# Altium schematic sheet Power_Neg15.SchDoc: Geracao interna de -15 V
size A3; Project: CM5 Photonic Bias Controller; DocumentRev: R5; ProjectRev: R5; Version: Rev R6; SheetNumber: 17; SheetTotal: 17; Author: Carlos Renan; SCH_SCALE: N/A; Address1: UFCG; Address2: Referencia: VIRTUS CC; Address3: Campina Grande - PB; ProjectName: Controle automatico de BIAS para MZM/IQ - Projeto 3; DocumentName: Power_Neg15.SchDoc
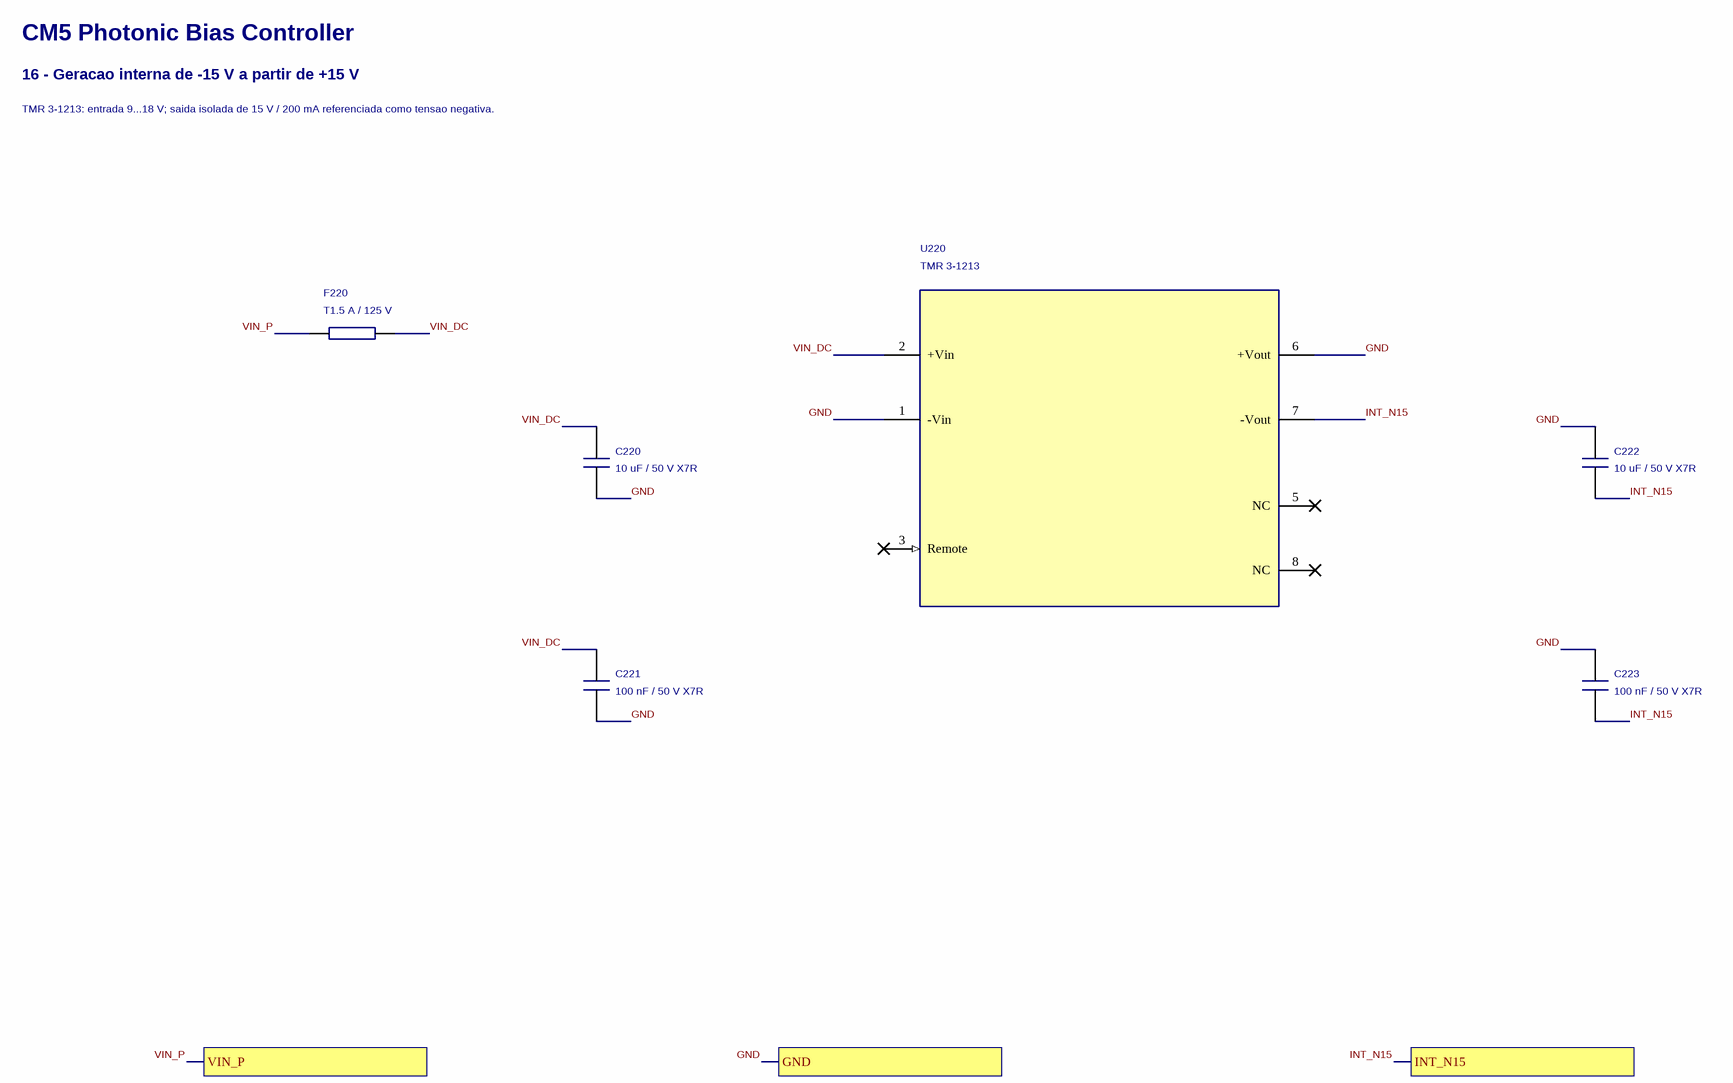
[diagram p0: Power_Neg15.SchDoc]

## Parts
C220  10 uF / 50 V X7R  [C1210]
C221  100 nF / 50 V X7R  [C0805]
C222  10 uF / 50 V X7R  [C1210]
C223  100 nF / 50 V X7R  [C0805]
F220  T1.5 A / 125 V  [FUSE_NANO2]
U220  TMR 3-1213  [TMR3_SIP8_15V]

## Ports
GND, INT_N15, VIN_P

## Nets
GND: C220.2 C221.2 C222.1 C223.1 U220.1(-Vin) U220.6(+Vout) ; port GND
INT_N15: C222.2 C223.2 U220.7(-Vout) ; port INT_N15
VIN_DC: C220.1 C221.1 F220.2 U220.2(+Vin)
VIN_P: F220.1 ; port VIN_P

Not connected (* = marked no-connect by the designer): U220 3(Remote)* 5(NC)* 8(NC)*

## Notes on the sheet
- CM5 Photonic Bias Controller
- 16 - Geracao interna de -15 V a partir de +15 V
- TMR 3-1213: entrada 9...18 V; saida isolada de 15 V / 200 mA referenciada como tensao negativa.
- REVISION
- DESCRIPTION
- DATE
- APPROVED
- ADDRESS
- PROJECT
- VERSION
- TITLE
- A3
- SIZE
- SCALE
- DOCUMENT NAME:
- DOCUMENT REVISION:
- OF
- SHEET:
- PROJECT REVISION:

## Library data of the parts
C220 C222 = 10uF_50V: Manufacturer: KEMET; Manufacturer Part Number: C1210C106K5RACTU; Review: Desacoplamento local do conversor; capacitor ceramico nao polarizado.; Procurement Status: Busca por MPN; SKU e disponibilidade a confirmar; BOM Purchase: Yes; Manufacturer 1: KEMET; Manufacturer Part Number 1: C1210C106K5RACTU; Supplier 1: DigiKey; Supplier URL 1: https://www.digikey.com.br/pt/products/result?keywords=C1210C106K5RACTU; Supplier 2: Mouser; Supplier URL 2: https://br.mouser.com/c/?q=C1210C106K5RACTU; Datasheet: https://www.yageogroup.com/download/specsheet/C1210C106K5RACTU
C221 C223 = 100nF_50V: Manufacturer: KEMET; Manufacturer Part Number: C0805C104K5RACTU; Procurement Status: Busca por MPN; SKU e disponibilidade a confirmar; BOM Purchase: Yes; Manufacturer 1: KEMET; Manufacturer Part Number 1: C0805C104K5RACTU; Supplier 1: DigiKey; Supplier URL 1: https://www.digikey.com.br/pt/products/result?keywords=C0805C104K5RACTU; Supplier 2: Mouser; Supplier URL 2: https://br.mouser.com/c/?q=C0805C104K5RACTU; Datasheet: https://www.yageogroup.com/download/specsheet/C0805C104K5RACTU
F220 = T1.5A: Manufacturer: Littelfuse; Manufacturer Part Number: 045201.5MRL; Review: F220: 1,5 A retardado, Littelfuse 045201.5MRL. TRACO recomenda 1,6 A retardado; validar corrente de partida, I2t e coordenacao de protecao.; Procurement Status: MPN selecionado; SKU e disponibilidade a confirmar; BOM Purchase: Yes; Manufacturer 1: Littelfuse; Manufacturer Part Number 1: 045201.5MRL; Supplier 1: DigiKey; Supplier URL 1: https://www.digikey.com/en/products/result?keywords=045201.5MRL; Supplier 2: Mouser; Supplier URL 2: https://www.mouser.com/c/?q=045201.5MRL; Datasheet: https://www.mouser.com/datasheet/2/240/Littelfuse_452_454-58610.pdf
U220 = TMR 3-1213: DC/DC 3 W: +15 V para -15 V / 200 mA; Manufacturer: TRACO Power; Procurement Status: Busca por MPN; SKU e disponibilidade a confirmar; BOM Purchase: Yes; Manufacturer Part Number: TMR 3-1213; Manufacturer 1: TRACO Power; Manufacturer Part Number 1: TMR 3-1213; Supplier 1: DigiKey; Supplier URL 1: https://www.digikey.com/en/products/result?keywords=TMR%203-1213; Supplier 2: Mouser; Supplier URL 2: https://www.mouser.com/c/?q=TMR%203-1213; Datasheet: https://www.tracopower.com/products/tmr3.pdf